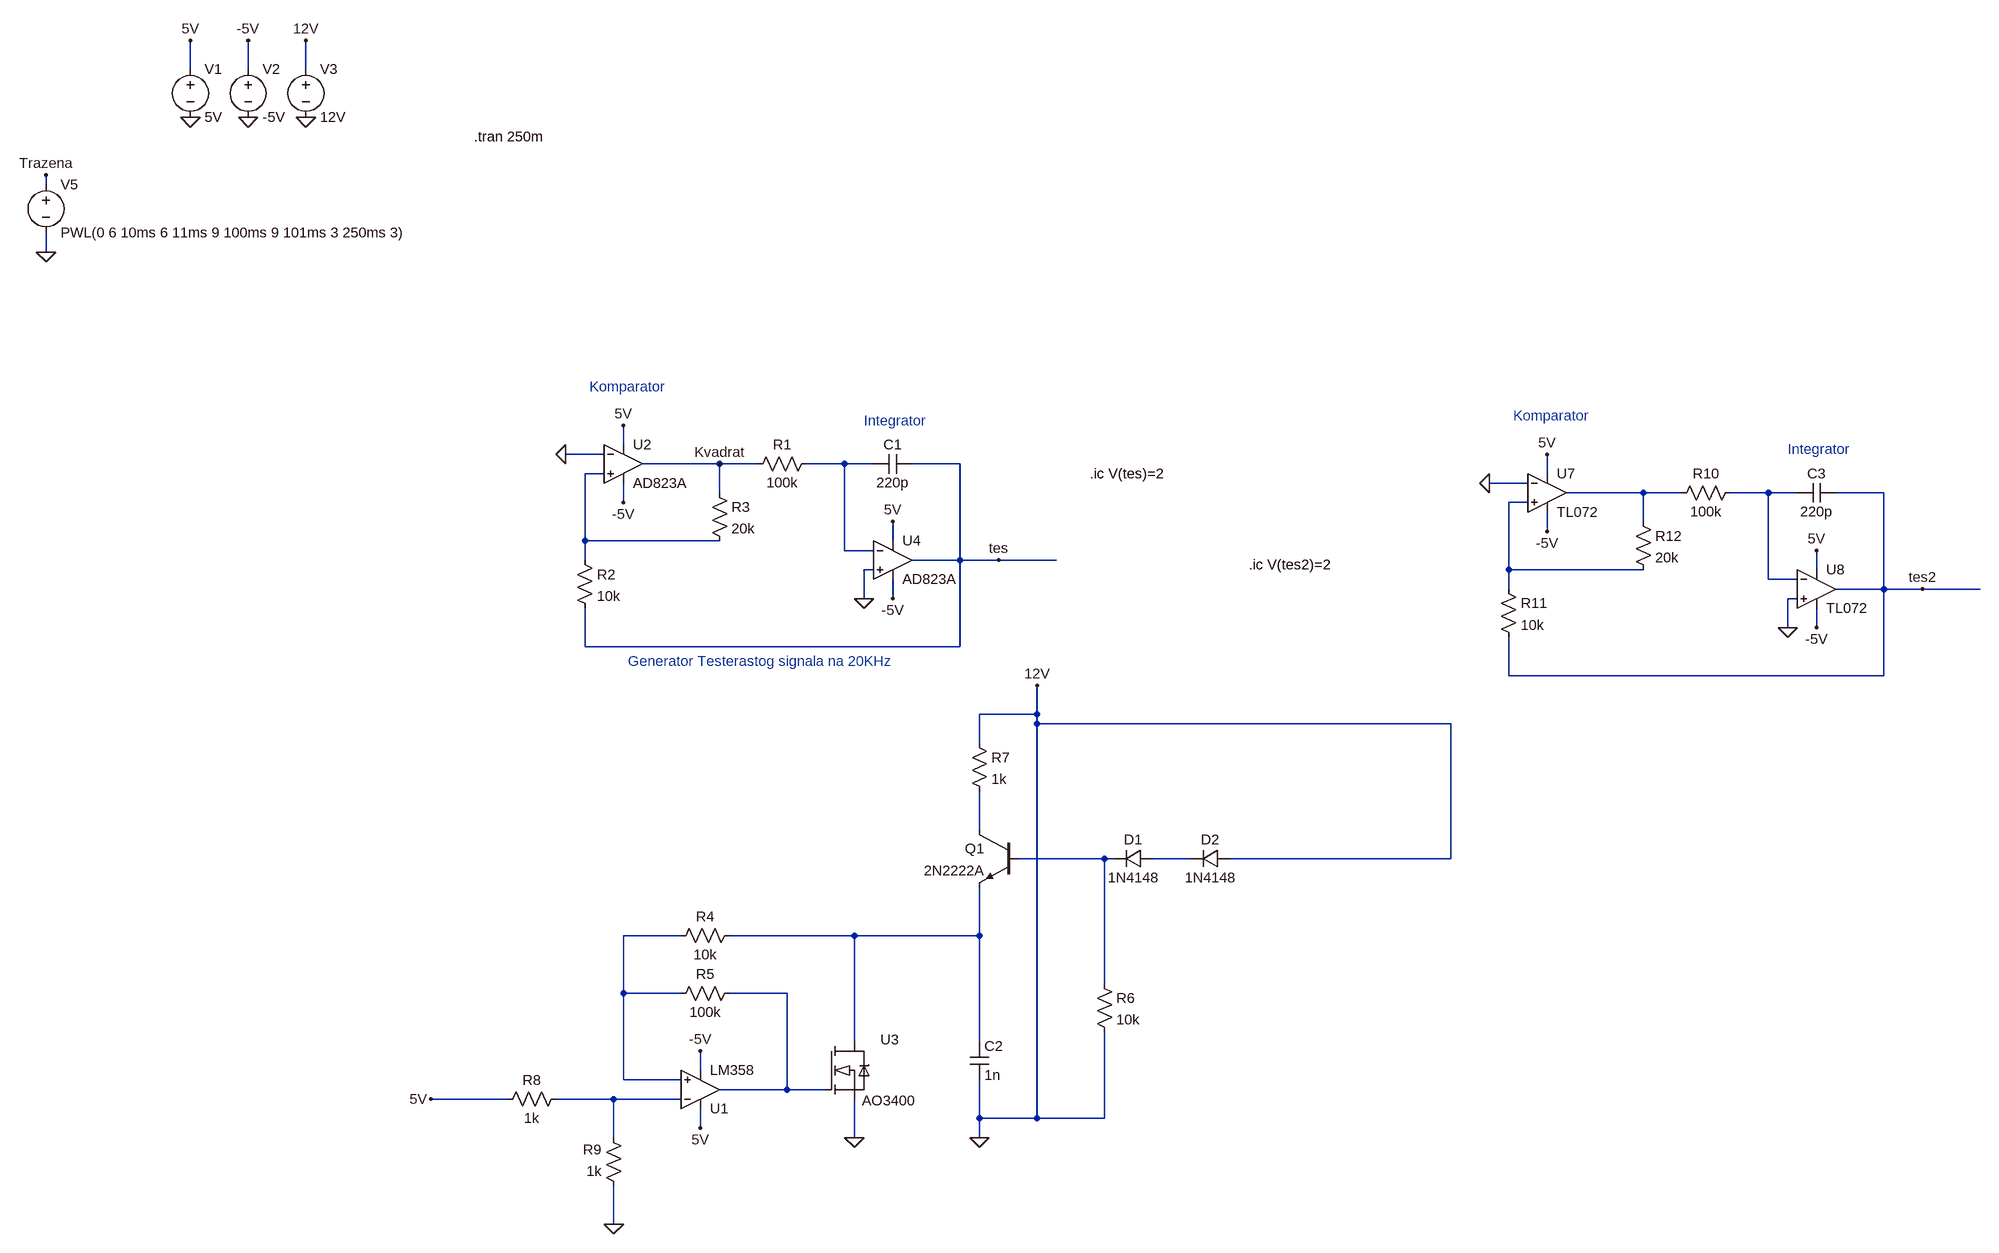
[diagram p0: schematic saw_gen.asc]
saw_gen.asc, the LTspice schematic file:
Version 4
SHEET 1 6380 2180
WIRE -1152 -816 -1152 -864
WIRE -1056 -816 -1056 -864
WIRE -960 -816 -960 -864
WIRE -1392 -624 -1392 -640
WIRE -1392 -512 -1392 -544
WIRE -432 -192 -432 -224
WIRE -464 -176 -528 -176
WIRE -272 -160 -400 -160
WIRE -208 -160 -272 -160
WIRE -64 -160 -128 -160
WIRE -16 -160 -64 -160
WIRE 128 -160 48 -160
WIRE -464 -144 -496 -144
WIRE 1104 -144 1104 -176
WIRE 1072 -128 1008 -128
WIRE -272 -112 -272 -160
WIRE 1264 -112 1136 -112
WIRE 1328 -112 1264 -112
WIRE 1472 -112 1408 -112
WIRE 1520 -112 1472 -112
WIRE 1664 -112 1584 -112
WIRE -432 -96 -432 -128
WIRE 1072 -96 1040 -96
WIRE 1264 -64 1264 -112
WIRE 1104 -48 1104 -80
WIRE -496 -32 -496 -144
WIRE -272 -32 -496 -32
WIRE 16 -32 16 -64
WIRE -64 -16 -64 -160
WIRE -16 -16 -64 -16
WIRE -496 0 -496 -32
WIRE 128 0 128 -160
WIRE 128 0 48 0
WIRE 192 0 128 0
WIRE 288 0 192 0
WIRE -16 16 -32 16
WIRE 1040 16 1040 -96
WIRE 1264 16 1040 16
WIRE 1552 16 1552 -16
WIRE 1472 32 1472 -112
WIRE 1520 32 1472 32
WIRE 1040 48 1040 16
WIRE 1664 48 1664 -112
WIRE 1664 48 1584 48
WIRE 1728 48 1664 48
WIRE 1824 48 1728 48
WIRE -32 64 -32 16
WIRE 16 64 16 32
WIRE 1520 64 1504 64
WIRE 1504 112 1504 64
WIRE 1552 112 1552 80
WIRE -496 144 -496 80
WIRE 128 144 128 0
WIRE 128 144 -496 144
WIRE 1040 192 1040 128
WIRE 1664 192 1664 48
WIRE 1664 192 1040 192
WIRE 256 256 256 208
WIRE 256 256 160 256
WIRE 256 272 256 256
WIRE 944 272 256 272
WIRE 160 304 160 256
WIRE 160 448 160 384
WIRE 368 496 224 496
WIRE 384 496 368 496
WIRE 512 496 448 496
WIRE 944 496 944 272
WIRE 944 496 576 496
WIRE -336 624 -432 624
WIRE -48 624 -256 624
WIRE 160 624 160 544
WIRE 160 624 -48 624
WIRE 368 704 368 496
WIRE -432 720 -432 624
WIRE -336 720 -432 720
WIRE -160 720 -256 720
WIRE -48 800 -48 624
WIRE 160 800 160 624
WIRE -304 848 -304 816
WIRE -432 864 -432 720
WIRE -336 864 -432 864
WIRE -160 880 -160 720
WIRE -160 880 -272 880
WIRE -96 880 -160 880
WIRE -624 896 -752 896
WIRE -448 896 -544 896
WIRE -336 896 -448 896
WIRE 160 928 160 864
WIRE 256 928 256 272
WIRE 256 928 160 928
WIRE 368 928 368 784
WIRE 368 928 256 928
WIRE -304 944 -304 912
WIRE -448 960 -448 896
WIRE -48 960 -48 896
WIRE 160 960 160 928
WIRE -448 1104 -448 1040
FLAG -1152 -736 0
FLAG -1152 -864 5V
FLAG -1056 -736 0
FLAG -1056 -864 -5V
FLAG -960 -736 0
FLAG -960 -864 12V
FLAG -32 64 0
FLAG -528 -176 0
FLAG -432 -96 -5V
FLAG -432 -224 5V
FLAG 16 -64 5V
FLAG -272 -160 Kvadrat
FLAG 16 64 -5V
FLAG -1392 -512 0
FLAG -1392 -640 Trazena
FLAG 192 0 tes
FLAG -304 944 5V
FLAG 160 960 0
FLAG -48 960 0
FLAG -752 896 5V
FLAG 256 208 12V
FLAG -448 1104 0
FLAG -304 816 -5V
FLAG 1504 112 0
FLAG 1008 -128 0
FLAG 1104 -48 -5V
FLAG 1104 -176 5V
FLAG 1552 -16 5V
FLAG 1552 112 -5V
FLAG 1728 48 tes2
SYMBOL voltage -1152 -832 R0
WINDOW 123 0 0 Left 0
WINDOW 39 0 0 Left 0
SYMATTR InstName V1
SYMATTR Value 5V
SYMBOL voltage -1056 -832 R0
WINDOW 123 0 0 Left 0
WINDOW 39 0 0 Left 0
SYMATTR InstName V2
SYMATTR Value -5V
SYMBOL voltage -960 -832 R0
WINDOW 123 0 0 Left 0
WINDOW 39 0 0 Left 0
SYMATTR InstName V3
SYMATTR Value 12V
SYMBOL res -112 -176 R90
WINDOW 0 0 56 VBottom 2
WINDOW 3 32 56 VTop 2
SYMATTR InstName R1
SYMATTR Value 100k
SYMBOL cap 48 -176 R90
WINDOW 0 0 32 VBottom 2
WINDOW 3 32 32 VTop 2
SYMATTR InstName C1
SYMATTR Value 220p
SYMBOL res -512 -16 R0
SYMATTR InstName R2
SYMATTR Value 10k
SYMBOL res -288 -128 R0
SYMATTR InstName R3
SYMATTR Value 20k
SYMBOL OpAmps\\AD823A 16 -64 R0
SYMATTR InstName U4
SYMBOL voltage -1392 -640 R0
WINDOW 123 0 0 Left 0
WINDOW 39 0 0 Left 0
SYMATTR InstName V5
SYMATTR Value PWL(0 6 10ms 6 11ms 9 100ms 9 101ms 3 250ms 3)
SYMBOL OpAmps\\AD823A -432 -224 R0
SYMATTR InstName U2
SYMBOL ZZZ\\OpAmp\\LM358 -304 880 M180
SYMATTR InstName U1
SYMBOL AO3400 -16 864 R0
SYMATTR InstName U3
SYMBOL res -240 608 R90
WINDOW 0 0 56 VBottom 2
WINDOW 3 32 56 VTop 2
SYMATTR InstName R4
SYMATTR Value 10k
SYMBOL res -240 704 R90
WINDOW 0 0 56 VBottom 2
WINDOW 3 32 56 VTop 2
SYMATTR InstName R5
SYMATTR Value 100k
SYMBOL cap 144 800 R0
SYMATTR InstName C2
SYMATTR Value 1n
SYMBOL npn 224 448 M0
SYMATTR InstName Q1
SYMATTR Value 2N2222A
SYMBOL diode 448 480 R90
WINDOW 0 0 32 VBottom 2
WINDOW 3 32 32 VTop 2
SYMATTR InstName D1
SYMATTR Value 1N4148
SYMBOL diode 576 480 R90
WINDOW 0 0 32 VBottom 2
WINDOW 3 32 32 VTop 2
SYMATTR InstName D2
SYMATTR Value 1N4148
SYMBOL res 352 688 R0
SYMATTR InstName R6
SYMATTR Value 10k
SYMBOL res 144 288 R0
SYMATTR InstName R7
SYMATTR Value 1k
SYMBOL res -528 880 R90
WINDOW 0 0 56 VBottom 2
WINDOW 3 32 56 VTop 2
SYMATTR InstName R8
SYMATTR Value 1k
SYMBOL res -432 1056 R180
WINDOW 0 36 76 Left 2
WINDOW 3 36 40 Left 2
SYMATTR InstName R9
SYMATTR Value 1k
SYMBOL res 1424 -128 R90
WINDOW 0 0 56 VBottom 2
WINDOW 3 32 56 VTop 2
SYMATTR InstName R10
SYMATTR Value 100k
SYMBOL cap 1584 -128 R90
WINDOW 0 0 32 VBottom 2
WINDOW 3 32 32 VTop 2
SYMATTR InstName C3
SYMATTR Value 220p
SYMBOL res 1024 32 R0
SYMATTR InstName R11
SYMATTR Value 10k
SYMBOL res 1248 -80 R0
SYMATTR InstName R12
SYMATTR Value 20k
SYMBOL ZZZ\\OpAmp\\TL072 1104 -112 R0
SYMATTR InstName U7
SYMBOL ZZZ\\OpAmp\\TL072 1552 48 R0
SYMATTR InstName U8
TEXT -680 -704 Left 2 !.tran 250m
TEXT -424 168 Left 2 ;Generator Testerastog signala na 20KHz
TEXT -32 -232 Left 2 ;Integrator
TEXT -488 -288 Left 2 ;Komparator
TEXT 344 -144 Left 2 !.ic V(tes)=2
TEXT 1504 -184 Left 2 ;Integrator
TEXT 1048 -240 Left 2 ;Komparator
TEXT 608 8 Left 2 !.ic V(tes2)=2

The netlist it stands for:
* saw_gen.asc
V1 5V 0 5V
V2 -5V 0 -5V
V3 0 0 12V
R1 N001 Kvadrat 100k
C1 tes N001 220p
R2 N002 tes 10k
R3 Kvadrat N002 20k
XU4 0 N001 5V -5V tes AD823A  ; pins In+ In- V+ V- OUT
V5 Trazena 0 PWL(0 6 10ms 6 11ms 9 100ms 9 101ms 3 250ms 3)
XU2 N002 0 5V -5V Kvadrat AD823A  ; pins In+ In- V+ V- OUT
XU1 N009 N012 5V -5V N011 LM358  ; pins In+ In- V+ V- OUT
XU3 N010 N011 0 AO3400  ; pins 1 4 2
R4 N010 N009 10k
R5 N011 N009 100k
C2 N010 0 1n
Q1 N006 N007 N010 0 2N2222A
D1 N008 N007 1N4148
D2 0 N008 1N4148
R6 N007 0 10k
R7 0 N006 1k
R8 N012 5V 1k
R9 0 N012 1k
R10 N004 N003 100k
C3 tes2 N004 220p
R11 N005 tes2 10k
R12 N003 N005 20k
* U7: TL072 (symbol ZZZ\OpAmp\TL072 not available, pins judged from their places): In+=N005 In-=0 V+=5V V-=-5V OUT=N003
* U8: TL072 (symbol ZZZ\OpAmp\TL072 not available, pins judged from their places): In+=0 In-=N004 V+=5V V-=-5V OUT=tes2
.model D D
.lib standard.dio
.model NPN NPN
.model PNP PNP
.lib standard.bjt
.tran 250m
* Generator Testerastog signala na 20KHz
* Integrator
* Komparator
.ic V(tes)=2
* Integrator
* Komparator
.ic V(tes2)=2
.lib AO3400.mod
.backanno
.end